# Altium project Ezlo_Voice_Assistant_Node.PrjPcb (part 2 of 2)

## Sheet ADC_Section.SchDoc
size A4; SheetNumber: 3; SheetTotal: 5
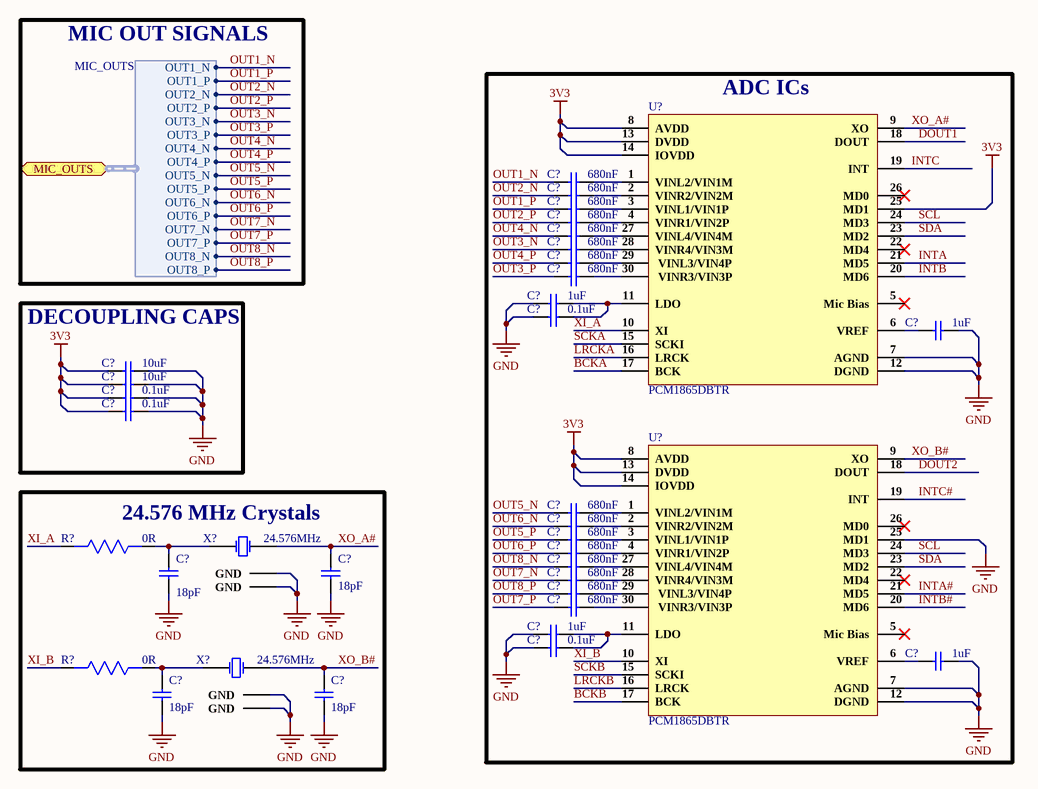
[diagram p2: ADC_Section.SchDoc]

### Parts
(Parts that share a designator on the sheet are numbered #1, #2 ... from top to bottom, then left to right.)
C?#17  680nF  [Cap 0603]
C?#18  680nF  [Cap 0603]
C?#19  680nF  [Cap 0603]
C?#20  680nF  [Cap 0603]
C?#21  680nF  [Cap 0603]
C?#22  680nF  [Cap 0603]
C?#23  680nF  [Cap 0603]
C?#24  680nF  [Cap 0603]
C?#25  1uF  [Cap 0603]
C?#26  0.1uF  [Cap 0603]
C?#27  1uF  [Cap 0603]
C?#28  10uF  [Cap 0603]
C?#29  10uF  [Cap 0603]
C?#30  0.1uF  [Cap 0603]
C?#31  0.1uF  [Cap 0603]
C?#32  680nF  [Cap 0603]
C?#33  680nF  [Cap 0603]
C?#34  680nF  [Cap 0603]
C?#35  680nF  [Cap 0603]
C?#36  680nF  [Cap 0603]
C?#37  680nF  [Cap 0603]
C?#38  18pF  [Cap 0603]
C?#39  18pF  [Cap 0603]
C?#40  680nF  [Cap 0603]
C?#41  680nF  [Cap 0603]
C?#42  1uF  [Cap 0603]
C?#43  0.1uF  [Cap 0603]
C?#44  1uF  [Cap 0603]
C?#45  18pF  [Cap0603]
C?#46  18pF  [Cap0603]
R?#8  0R  [Res0603]
R?#9  0R  [Res0603]
U?#7  PCM1865DBTR  [PCM1865DBTR]
U?#8  PCM1865DBTR  [PCM1865DBTR]
X?#2  24.576MHz  [S3224576121060]
X?#3  24.576MHz  [S3224576121060]

### Blocks framed on the sheet
ADC ICs: C?#17-C?#27 C?#32-C?#37 C?#40-C?#44 U?#7 U?#8
DECOUPLING CAPS: C?#28-C?#31
24.576 MHz Crystals: C?#38 C?#39 C?#45 C?#46 R?#8 R?#9 X?#2 X?#3

### Ports
MIC_OUTS (bidir, harness MIC_OUTS)

### Harnesses
MIC_OUTS: OUT1_N, OUT1_P, OUT2_N, OUT2_P, OUT3_N, OUT3_P, OUT4_N, OUT4_P, OUT5_N, OUT5_P, OUT6_N, OUT6_P, OUT7_N, OUT7_P, OUT8_N, OUT8_P

### Nets
3V3: C?#28.1 C?#29.1 C?#30.1 C?#31.1 U?#7.8(AVDD) U?#7.13(DVDD) U?#7.14(IOVDD) U?#7.25(MD1) U?#8.8(AVDD) U?#8.13(DVDD) U?#8.14(IOVDD)
GND: C?#25.1 C?#26.1 C?#27.2 C?#28.2 C?#29.2 C?#30.2 C?#31.2 C?#38.1 C?#39.1 C?#42.1 C?#43.1 C?#44.2 C?#45.1 C?#46.1 U?#7.7(AGND) U?#7.12(DGND) U?#8.7(AGND) U?#8.12(DGND) U?#8.25(MD1) X?#2.2(GND) X?#2.4(GND) X?#3.2(GND) X?#3.4(GND)
BCKA: U?#7.17(BCK)
BCKB: U?#8.17(BCK)
DOUT1: U?#7.18(DOUT)
DOUT2: U?#8.18(DOUT)
INTA: U?#7.21(MD5)
INTA#: U?#8.21(MD5)
INTB: U?#7.20(MD6)
INTB#: U?#8.20(MD6)
INTC: U?#7.19(INT)
INTC#: U?#8.19(INT)
LRCKA: U?#7.16(LRCK)
LRCKB: U?#8.16(LRCK)
OUT1_N: C?#17.1 ; port MIC_OUTS.OUT1_N
OUT1_P: C?#19.1 ; port MIC_OUTS.OUT1_P
OUT2_N: C?#18.1 ; port MIC_OUTS.OUT2_N
OUT2_P: C?#20.1 ; port MIC_OUTS.OUT2_P
OUT3_N: C?#22.1 ; port MIC_OUTS.OUT3_N
OUT3_P: C?#24.1 ; port MIC_OUTS.OUT3_P
OUT4_N: C?#21.1 ; port MIC_OUTS.OUT4_N
OUT4_P: C?#23.1 ; port MIC_OUTS.OUT4_P
OUT5_N: C?#32.1 ; port MIC_OUTS.OUT5_N
OUT5_P: C?#34.1 ; port MIC_OUTS.OUT5_P
OUT6_N: C?#33.1 ; port MIC_OUTS.OUT6_N
OUT6_P: C?#35.1 ; port MIC_OUTS.OUT6_P
OUT7_N: C?#37.1 ; port MIC_OUTS.OUT7_N
OUT7_P: C?#41.1 ; port MIC_OUTS.OUT7_P
OUT8_N: C?#36.1 ; port MIC_OUTS.OUT8_N
OUT8_P: C?#40.1 ; port MIC_OUTS.OUT8_P
SCKA: U?#7.15(SCKI)
SCKB: U?#8.15(SCKI)
SCL: U?#7.24(MD3) U?#8.24(MD3)
SDA: U?#7.23(MD2) U?#8.23(MD2)
XI_A: R?#8.2 U?#7.10(XI)
XI_B: R?#9.2 U?#8.10(XI)
XO_A#: C?#39.2 U?#7.9(XO) X?#2.3(OSC2)
XO_B#: C?#46.2 U?#8.9(XO) X?#3.3(OSC2)
NetC?#17_2: C?#17.2 U?#7.1(VINL2/VIN1M)
NetC?#18_2: C?#18.2 U?#7.2(VINR2/VIN2M)
NetC?#19_2: C?#19.2 U?#7.3(VINL1/VIN1P)
NetC?#20_2: C?#20.2 U?#7.4(VINR1/VIN2P)
NetC?#21_2: C?#21.2 U?#7.27(VINL4/VIN4M)
NetC?#22_2: C?#22.2 U?#7.28(VINR4/VIN3M)
NetC?#23_2: C?#23.2 U?#7.29(VINL3/VIN4P)
NetC?#24_2: C?#24.2 U?#7.30(VINR3/VIN3P)
NetC?#25_2: C?#25.2 C?#26.2 U?#7.11(LDO)
NetC?#27_1: C?#27.1 U?#7.6(VREF)
NetC?#32_2: C?#32.2 U?#8.1(VINL2/VIN1M)
NetC?#33_2: C?#33.2 U?#8.2(VINR2/VIN2M)
NetC?#34_2: C?#34.2 U?#8.3(VINL1/VIN1P)
NetC?#35_2: C?#35.2 U?#8.4(VINR1/VIN2P)
NetC?#36_2: C?#36.2 U?#8.27(VINL4/VIN4M)
NetC?#37_2: C?#37.2 U?#8.28(VINR4/VIN3M)
NetC?#38_2: C?#38.2 R?#8.1 X?#2.1(OSC1)
NetC?#40_2: C?#40.2 U?#8.29(VINL3/VIN4P)
NetC?#41_2: C?#41.2 U?#8.30(VINR3/VIN3P)
NetC?#42_2: C?#42.2 C?#43.2 U?#8.11(LDO)
NetC?#44_1: C?#44.1 U?#8.6(VREF)
NetC?#45_2: C?#45.2 R?#9.1 X?#3.1(OSC1)

Not connected (* = marked no-connect by the designer): U?#7 5(Mic_Bias)* 22(MD4)* 26(MD0)*; U?#8 5(Mic_Bias)* 22(MD4)* 26(MD0)*

### Notes on the sheet
- MIC OUT SIGNALS
- 1
- Huzaifa Ali

### Library data of the parts
C?#17-C?#24 C?#32-C?#37 C?#40 C?#41 = CC0603KRX7R8BB684: CAP CER 0.68uF 25V X7R 10% 0603 Paper T/R; Manufacturer: Yageo; Supplier 1: Arrow Electronics; Manufacturer Part Number: CC0603KRX7R8BB684; RoHS: Yes; Category: Ceramic Capacitors; Stock 1: 8000; Pricing 1: 4000=0.02130, 8000=0.01830 (USD); Supplier Part Number 1: CC0603KRX7R8BB684
C?#25 C?#27 C?#42 C?#44 = CC0603KRX5R8BB105: CAP CER 1UF 25V X5R 0603; Manufacturer: Yageo; Tolerance: 10%; Supplier 1: Digi-Key; Manufacturer Part Number: CC0603KRX5R8BB105; RoHS: Yes; Category: Ceramic Capacitors; Stock 1: 919939; Pricing 1: 1=0.12000, 10=0.08400, 50=0.04760, 100=0.03940, 500=0.02764, 1000=0.02288 (USD); Mount: Surface Mount; Case/Package: 0603; Number of Pins: 2; Case Code (Metric): 1608; Case Code (Imperial): 0603; Min Operating Temperature: -55°C; Max Operating Temperature: 85°C; Capacitance: 1uF; Dielectric: X5R; Package Quantity: 1; Voltage Rating: 25V; Packaging: Tape and Reel; Termination: SMD/SMT; Voltage Rating (DC): 25V; Series: CC; Construction: Flat; Length: 1.6mm; Width: 0.031inch; Height: 0.8mm; Thickness: 0.035inch; Depth: 0.8mm; Radiation Hardening: No; REACH SVHC: No SVHC; Lead Free: Lead Free; Halogen Free: Halogen Free; RoHS Compliant: Yes; ComponentLink1URL: https://datasheet.ciiva.com/176/mlccorderingcode-176785.pdf?src-supplier=Digi-Key; ComponentLink1Description: https://datasheet.ciiva.com/176/mlccorderingcode-176785.pdf?src-supplier=Digi-Key; ComponentLink2URL: https://datasheet.ciiva.com/176/mlccorderingcode-176786.pdf?src-supplier=Digi-Key; ComponentLink2Description: https://datasheet.ciiva.com/176/mlccorderingcode-176786.pdf?src-supplier=Digi-Key; ComponentLink3URL: https://datasheet.ciiva.com/176/mlccorderingcode-176787.pdf?src-supplier=Digi-Key; ComponentLink3Description: https://datasheet.ciiva.com/176/mlccorderingcode-176787.pdf?src-supplier=Digi-Key; ComponentLink4URL: https://datasheet.ciiva.com/17436/upy-gphc-x5r-4v-to-50v-12-17436952.pdf?src-supplier=Avnet+Europe; ComponentLink4Description: https://datasheet.ciiva.com/17436/upy-gphc-x5r-4v-to-50v-12-17436952.pdf?src-supplier=Avnet+Europe; ComponentLink5URL: https://datasheet.ciiva.com/7978/1525783-7978171.pdf?src-supplier=Element14; ComponentLink5Description: https://datasheet.ciiva.com/7978/1525783-7978171.pdf?src-supplier=Element14; ComponentLink6URL: https://datasheet.ciiva.com/11586/upy-gphc-x5r-4v-to-50v-12-11586318.pdf?src-supplier=Avnet; ComponentLink6Description: https://datasheet.ciiva.com/11586/upy-gphc-x5r-4v-to-50v-12-11586318.pdf?src-supplier=Avnet; Supplier Part Number 1: 311-1445-1-ND
C?#26 C?#30 C?#31 C?#43 = CC0603KRX7R0BB104: CAP CER 0.1UF 100V X7R 0603; Manufacturer: Yageo; Capacitance: 100nF; Tolerance: 10%; Supplier 1: Digi-Key; Manufacturer Part Number: CC0603KRX7R0BB104; RoHS: Yes; Category: Ceramic Capacitors; Stock 1: 60476; Pricing 1: 1=0.19000, 10=0.13500, 50=0.07680, 100=0.06370, 500=0.04466, 1000=0.03696 (USD); Mount: Surface Mount; Case/Package: 0603; Case Code (Metric): 1608; Case Code (Imperial): 0603; Weight: 7.1E-05oz; Min Operating Temperature: -55°C; Max Operating Temperature: 125°C; Package Quantity: 4000; Voltage Rating: 100V; Packaging: Tape and Reel; Dielectric: X7R; Termination: SMD/SMT; Resistor Type: Ceramic; Voltage Rating (DC): 100V; Series: CC; Length: 0.063inch; Width: 0.031inch; Thickness: 0.035inch; Depth: 0.8mm; Lead Free: Lead Free; RoHS Compliant: Yes; ComponentLink1URL: https://datasheet.ciiva.com/6277/mlccorderingcode-6277030.pdf?src-supplier=Digi-Key; ComponentLink1Description: https://datasheet.ciiva.com/6277/mlccorderingcode-6277030.pdf?src-supplier=Digi-Key; ComponentLink2URL: https://datasheet.ciiva.com/6277/mlccorderingcode-6277081.pdf?src-supplier=Digi-Key; ComponentLink2Description: https://datasheet.ciiva.com/6277/mlccorderingcode-6277081.pdf?src-supplier=Digi-Key; ComponentLink3URL: https://datasheet.ciiva.com/6277/mlccorderingcode-6277082.pdf?src-supplier=Digi-Key; ComponentLink3Description: https://datasheet.ciiva.com/6277/mlccorderingcode-6277082.pdf?src-supplier=Digi-Key; Supplier Part Number 1: 311-1523-1-ND
C?#28 C?#29 = CL10A106MA8NRNC: CAP CER 10UF 25V X5R 0603; Manufacturer: Samsung; Tolerance: 20%; Supplier 1: Avnet; Manufacturer Part Number: CL10A106MA8NRNC; RoHS: Yes; Category: Ceramic Capacitors; Pricing 1: 4000=0.03753, 8000=0.03700, 16000=0.03595, 24000=0.03515, 32000=0.03383, 40000=0.03304, 400000=0.03225 (USD); Mount: Surface Mount; Case/Package: 0603; Case Code (Metric): 1608; Case Code (Imperial): 0603; Contact Plating: Tin; Min Operating Temperature: -55°C; Max Operating Temperature: 85°C; Package Quantity: 1; Packaging: Tape and Reel; Capacitance: 10uF; Voltage Rating: 25V; Dielectric: X5R; Termination: Wraparound; Series: CL; Construction: Flat; Length: 0.063inch; Width: 0.031inch; Thickness: 0.035inch; Lead Free: Lead Free; RoHS Compliant: Yes; ComponentLink1URL: https://datasheet.ciiva.com/25766/cl10a106ma8nrnc-25766562.pdf?src-supplier=Digi-Key; ComponentLink1Description: https://datasheet.ciiva.com/25766/cl10a106ma8nrnc-25766562.pdf?src-supplier=Digi-Key; Supplier Part Number 1: CL10A106MA8NRNC
C?#38 C?#39 = CC0603JRNPO9BN180: CAP SMD 18pF ±5.0% 50V NPO 0603; Manufacturer: Yageo; Tolerance: 5%; Dielectric: C0G; Temperature Coefficient: 30ppm/°C; Insulation Resistance: 100GR; Supplier 1: Newark; Manufacturer Part Number: CC0603JRNPO9BN180; RoHS: Yes; Category: Ceramic Capacitors; Stock 1: 77880; Pricing 1: 1=0.09900, 25=0.08000, 50=0.06900, 100=0.04700, 250=0.03600, 500=0.02800, 1000=0.02300, 2500=0.01900 (USD); Mount: Surface Mount; Case/Package: 0603; Number of Pins: 2; Case Code (Metric): 1608; Case Code (Imperial): 0603; Min Operating Temperature: -55°C; Max Operating Temperature: 125°C; Capacitance: 18pF; Packaging: Tape and Reel; Voltage Rating: 50V; Voltage Rating (DC): 50V; Package Quantity: 1; Termination: SMD/SMT; Resistor Type: Ceramic; Series: CC; Length: 1.6mm; Width: 0.031inch; Height: 0.8mm; Thickness: 0.035inch; Depth: 0.8mm; Radiation Hardening: No; REACH SVHC: No SVHC; Lead Free: Lead Free; RoHS Compliant: Yes; ComponentLink1URL: https://datasheet.ciiva.com/144/mlccorderingcode-144638.pdf?src-supplier=Digi-Key; ComponentLink1Description: https://datasheet.ciiva.com/144/mlccorderingcode-144638.pdf?src-supplier=Digi-Key; ComponentLink2URL: https://datasheet.ciiva.com/144/mlccorderingcode-144637.pdf?src-supplier=Digi-Key; ComponentLink2Description: https://datasheet.ciiva.com/144/mlccorderingcode-144637.pdf?src-supplier=Digi-Key; ComponentLink3URL: https://datasheet.ciiva.com/144/mlccorderingcode-144639.pdf?src-supplier=Digi-Key; ComponentLink3Description: https://datasheet.ciiva.com/144/mlccorderingcode-144639.pdf?src-supplier=Digi-Key; ComponentLink4URL: https://datasheet.ciiva.com/28450/1443161-28450477.pdf?src-supplier=Element14; ComponentLink4Description: https://datasheet.ciiva.com/28450/1443161-28450477.pdf?src-supplier=Element14; ComponentLink5URL: https://datasheet.ciiva.com/46430/1835847-46430152.pdf?src-supplier=Element14; ComponentLink5Description: https://datasheet.ciiva.com/46430/1835847-46430152.pdf?src-supplier=Element14; ComponentLink6URL: https://datasheet.ciiva.com/5425/upy-gp-np0-16v-to-50v-8-5425439.pdf?src-supplier=Mouser; ComponentLink6Description: https://datasheet.ciiva.com/5425/upy-gp-np0-16v-to-50v-8-5425439.pdf?src-supplier=Mouser; ComponentLink7URL: https://datasheet.ciiva.com/8033/1734582-8033733.pdf?src-supplier=Element14; ComponentLink7Description: https://datasheet.ciiva.com/8033/1734582-8033733.pdf?src-supplier=Element14; ComponentLink8URL: https://datasheet.ciiva.com/11587/upy-gp-np0-16v-to-50v-8-11587323.pdf?src-supplier=Avnet; ComponentLink8Description: https://datasheet.ciiva.com/11587/upy-gp-np0-16v-to-50v-8-11587323.pdf?src-supplier=Avnet; Supplier Part Number 1: 68R4719
C?#45 C?#46 = CC0603JRNPO9BN180: CAP CER 18PF 50V C0G/NPO 0603; Manufacturer: Yageo; Tolerance: 5%; Dielectric: C0G; Temperature Coefficient: 30ppm/°C; Insulation Resistance: 100GR; Supplier 1: Digi-Key; Manufacturer Part Number: CC0603JRNPO9BN180; RoHS: Yes; Category: Ceramic Capacitors; Stock 1: 936645; Pricing 1: 1=0.10000, 10=0.04000, 50=0.02200, 100=0.01790, 500=0.01282, 1000=0.01007 (USD); Mount: Surface Mount; Case/Package: 0603; Number of Pins: 2; Case Code (Metric): 1608; Case Code (Imperial): 0603; Min Operating Temperature: -55°C; Max Operating Temperature: 125°C; Capacitance: 18pF; Packaging: Tape and Reel; Voltage Rating: 50V; Voltage Rating (DC): 50V; Package Quantity: 1; Termination: SMD/SMT; Resistor Type: Ceramic; Series: CC; Length: 1.6mm; Width: 0.031inch; Height: 0.8mm; Thickness: 0.035inch; Depth: 0.8mm; Radiation Hardening: No; REACH SVHC: No SVHC; Lead Free: Lead Free; RoHS Compliant: Yes; ComponentLink1URL: https://datasheet.ciiva.com/144/mlccorderingcode-144638.pdf?src-supplier=Digi-Key; ComponentLink1Description: https://datasheet.ciiva.com/144/mlccorderingcode-144638.pdf?src-supplier=Digi-Key; ComponentLink2URL: https://datasheet.ciiva.com/144/mlccorderingcode-144637.pdf?src-supplier=Digi-Key; ComponentLink2Description: https://datasheet.ciiva.com/144/mlccorderingcode-144637.pdf?src-supplier=Digi-Key; ComponentLink3URL: https://datasheet.ciiva.com/144/mlccorderingcode-144639.pdf?src-supplier=Digi-Key; ComponentLink3Description: https://datasheet.ciiva.com/144/mlccorderingcode-144639.pdf?src-supplier=Digi-Key; ComponentLink4URL: https://datasheet.ciiva.com/28450/1443161-28450477.pdf?src-supplier=Element14; ComponentLink4Description: https://datasheet.ciiva.com/28450/1443161-28450477.pdf?src-supplier=Element14; ComponentLink5URL: https://datasheet.ciiva.com/46430/1835847-46430152.pdf?src-supplier=Element14; ComponentLink5Description: https://datasheet.ciiva.com/46430/1835847-46430152.pdf?src-supplier=Element14; ComponentLink6URL: https://datasheet.ciiva.com/5425/upy-gp-np0-16v-to-50v-8-5425439.pdf?src-supplier=Mouser; ComponentLink6Description: https://datasheet.ciiva.com/5425/upy-gp-np0-16v-to-50v-8-5425439.pdf?src-supplier=Mouser; ComponentLink7URL: https://datasheet.ciiva.com/8033/1734582-8033733.pdf?src-supplier=Element14; ComponentLink7Description: https://datasheet.ciiva.com/8033/1734582-8033733.pdf?src-supplier=Element14; ComponentLink8URL: https://datasheet.ciiva.com/11587/upy-gp-np0-16v-to-50v-8-11587323.pdf?src-supplier=Avnet; ComponentLink8Description: https://datasheet.ciiva.com/11587/upy-gp-np0-16v-to-50v-8-11587323.pdf?src-supplier=Avnet; Supplier Part Number 1: 311-1061-6-ND
R?#8 R?#9 = RC0603FR-070RL: RES SMD 0R, 1%, 0.1W, 0603; Manufacturer: Yageo; Resistance: 0mR; Power Rating: 100mW; Voltage Rating (DC): 50V; Temperature Coefficient: 200ppm/°C; Current Rating: 1A; Working Voltage: 75V; Supplier 1: Arrow Electronics; Manufacturer Part Number: RC0603FR-070RL; RoHS: Yes; Category: Chip SMD Resistors; Stock 1: 1270000; Pricing 1: 5000=0.00320, 5000=0.00490, 50000=0.00450, 500000=0.00250, 2500000=0.00150 (USD); Case/Package: 0603; Number of Pins: 2; Contact Plating: Tin,Matte; Case Code (Metric): 1608; Case Code (Imperial): 0603; Min Operating Temperature: -55°C; Max Operating Temperature: 155°C; Resistor Type: Thick Film; Packaging: Tape and Reel; Tolerance: 1%; Package Quantity: 5000; Voltage Rating: 50V; Number of Terminations: 2; Termination: SMD/SMT; Max Power Dissipation: 100mW; Features: Moisture Resistant; Length: 1.6mm; Width: 0.031inch; Height: 0.45mm; Depth: 0.8mm; Radiation Hardening: No; REACH SVHC: No SVHC; Lead Free: Lead Free; Military Standard: Not; ComponentLink1URL: https://datasheet.ciiva.com/11808/0900766b80f96399-11808172.pdf?src-supplier=RSComponents; ComponentLink1Description: https://datasheet.ciiva.com/11808/0900766b80f96399-11808172.pdf?src-supplier=RSComponents; ComponentLink2URL: https://datasheet.ciiva.com/5558/rc0603-272842-5558341.pdf?src-supplier=Mouser; ComponentLink2Description: https://datasheet.ciiva.com/5558/rc0603-272842-5558341.pdf?src-supplier=Mouser; ComponentLink3URL: https://datasheet.ciiva.com/46382/443971-46382072.pdf?src-supplier=Element14; ComponentLink3Description: https://datasheet.ciiva.com/46382/443971-46382072.pdf?src-supplier=Element14; ComponentLink4URL: https://datasheet.ciiva.com/29721/pyu-r-int-thick-7-29721178.pdf?src-supplier=Digi-Key; ComponentLink4Description: https://datasheet.ciiva.com/29721/pyu-r-int-thick-7-29721178.pdf?src-supplier=Digi-Key; ComponentLink5URL: https://datasheet.ciiva.com/5684/443971-5684699.pdf?src-supplier=Farnell; ComponentLink5Description: https://datasheet.ciiva.com/5684/443971-5684699.pdf?src-supplier=Farnell; ComponentLink6URL: https://datasheet.ciiva.com/7983/443971-7983627.pdf?src-supplier=Element14; ComponentLink6Description: https://datasheet.ciiva.com/7983/443971-7983627.pdf?src-supplier=Element14; ComponentLink7URL: https://datasheet.ciiva.com/29721/pyu-rc0603-51-rohs-l-4-29721179.pdf?src-supplier=Digi-Key; ComponentLink7Description: https://datasheet.ciiva.com/29721/pyu-rc0603-51-rohs-l-4-29721179.pdf?src-supplier=Digi-Key; ComponentLink8URL: https://datasheet.ciiva.com/22643/1868787-22643388.pdf?src-supplier=Element14; ComponentLink8Description: https://datasheet.ciiva.com/22643/1868787-22643388.pdf?src-supplier=Element14; Supplier Part Number 1: RC0603FR-070RL
U?#7 U?#8 = PCM1865DBTR: IC ADC/AUDIO 24BIT 192K 30TSSOP; Manufacturer: Texas Instruments; Interface: I2C,SPI,Serial; Operating Supply Voltage: 3.3V; Sampling Rate: 192KS/s; Resolution: 24b; Operating Supply Current: 31mA; Supply Type: Single; Number of A/D Converters: 4; Power Consumption: 145mW; Max Supply Voltage: 3.6V; Min Supply Voltage: 3V; Number of Analog Inputs: 8; Number of DAC Channels: 0; Supplier 1: Mouser; Manufacturer Part Number: PCM1865DBTR; RoHS: Yes; Category: Amplifiers - Audio; Pricing 1: 1=10.72000, 10=9.69000, 25=9.23000, 50=9.23000, 100=8.02000, 250=7.66000, 500=6.98000, 1000=6.54000, 10000=6.54000 (USD); Mount: Surface Mount; Case/Package: TSSOP; Number of Pins: 30; Weight: 0.003439oz; Contact Plating: Gold; Min Operating Temperature: -40°C; Max Operating Temperature: 125°C; Package Quantity: 2000; Packaging: Tape and Reel; Number of ADC Channels: 4; Lead Free: Lead Free; RoHS Compliant: Yes; ComponentLink1URL: https://datasheet.ciiva.com/48474/pcm1861-48474798.pdf?src-supplier=Avnet; ComponentLink1Description: https://datasheet.ciiva.com/48474/pcm1861-48474798.pdf?src-supplier=Avnet; ComponentLink2URL: https://datasheet.ciiva.com/29699/pcm1861-29699238.pdf?src-supplier=Digi-Key; ComponentLink2Description: https://datasheet.ciiva.com/29699/pcm1861-29699238.pdf?src-supplier=Digi-Key; Supplier Part Number 1: 595-PCM1865DBTR
X?#2 X?#3 = S3224576121060: 24.576MHz SMD Crystal Resonator 12pF 60Ω ±10ppm -40℃~+85℃ SMD3225-4P Crystals ROHS; Manufacturer: JGHC; Manufacturer Part Number: S3224576121060; Footprint: Custom; ComponentLink1Description: LCSC; ComponentLink1URL: https://lcsc.com/product-detail/Crystals_JGHC-S3224576121060_C390772.html; Value: 24.576MHz

## Sheet Memory_Section.SchDoc
size A; SheetNumber: 4; SheetTotal: 5
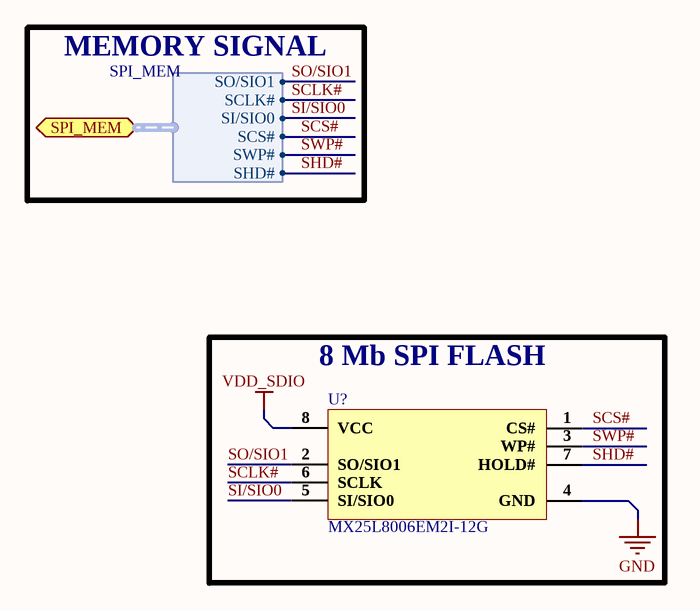
[diagram p3: Memory_Section.SchDoc]

### Parts
(Parts that share a designator on the sheet are numbered #1, #2 ... from top to bottom, then left to right.)
U?#9  MX25L8006EM2I-12G  [SOP- 8]

### Blocks framed on the sheet
8 Mb SPI FLASH: U?#9

### Ports
SPI_MEM (bidir, harness SPI_MEM)

### Harnesses
SPI_MEM: SO/SIO1, SCLK#, SI/SIO0, SCS#, SWP#, SHD#

### Nets
GND: U?#9.4(GND)
VDD_SDIO: U?#9.8(VCC)
SCLK#: U?#9.6(SCLK) ; port SPI_MEM.SCLK#
SCS#: U?#9.1(CS#) ; port SPI_MEM.SCS#
SHD#: U?#9.7(HOLD#) ; port SPI_MEM.SHD#
SI/SIO0: U?#9.5(SI/SIO0) ; port SPI_MEM.SI/SIO0
SO/SIO1: U?#9.2(SO/SIO1) ; port SPI_MEM.SO/SIO1
SWP#: U?#9.3(WP#) ; port SPI_MEM.SWP#

### Notes on the sheet
- MEMORY SIGNAL

### Library data of the parts
U?#9 = MX25L8006EM2I-12G: IC FLASH 8MBIT SPI 86MHZ 8SOP; Manufacturer: Macronix; Operating Supply Voltage: 3.6V; Density: 8Mb; Interface: SPI,Serial; Memory Type: Non-Volatile,FLASH; Supplier 1: Future Electronics; Manufacturer Part Number: MX25L8006EM2I-12G; RoHS: Yes; Category: Flash; Stock 1: 5568; Pricing 1: 1=0.54000, 75=0.47500, 250=0.46000, 750=0.44500, 2500=0.43000 (USD); Mount: Surface Mount; Case/Package: SOIC; Min Operating Temperature: -40°C; Max Operating Temperature: 85°C; Max Frequency: 86MHz; Packaging: Rail/Tube; Package Quantity: 98; Frequency: 86MHz; Memory Size: 8Mb; Series: MX25xxx05/06; Supply Voltage-Nom: 3.6V; Lead Free: Lead Free; Temperature Grade: INDUSTRIAL; RoHS Compliant: Yes; ComponentLink1URL: http://ckassoc.com/oldsite/pdf/Macronix_Product_Line_Card_July_2017_General%20_070617.pdf?src-supplier=Digi-Key; ComponentLink1Description: http://ckassoc.com/oldsite/pdf/Macronix_Product_Line_Card_July_2017_General%20_070617.pdf?src-supplier=Digi-Key; ComponentLink2URL: http://www.macronix.com/Lists/DataSheet/Attachments/1610/MX25L8006E,%203V,%208Mb,%20v1.4.pdf?src-supplier=Future+Electronics; ComponentLink2Description: http://www.macronix.com/Lists/DataSheet/Attachments/1610/MX25L8006E,%203V,%208Mb,%20v1.4.pdf?src-supplier=Future+Electronics; Supplier Part Number 1: 1123114

## Sheet Mic_Section.SchDoc
size A4; SheetNumber: 5; SheetTotal: 5
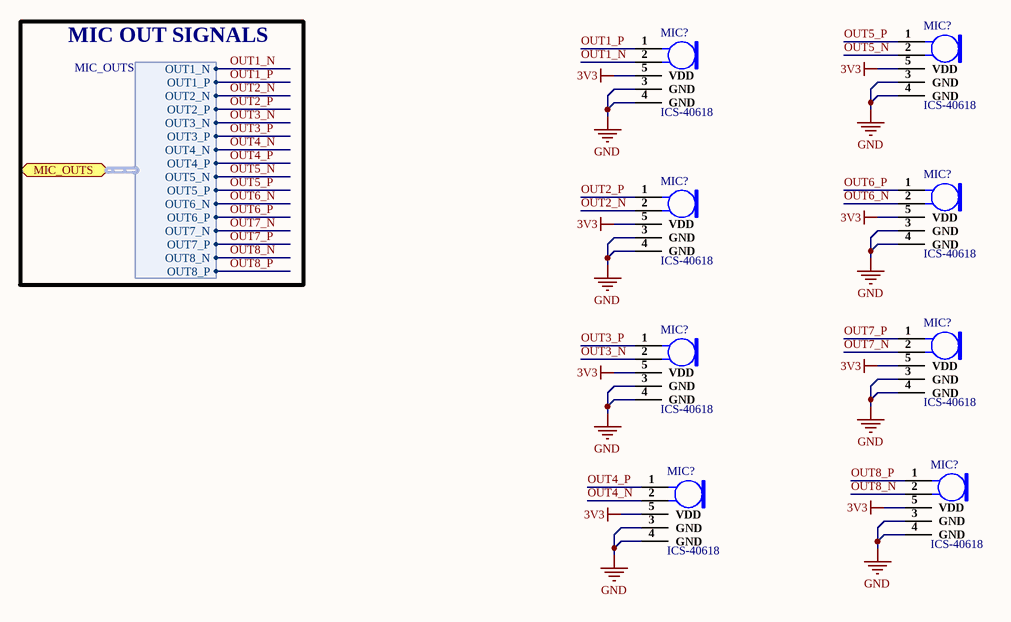
[diagram p4: Mic_Section.SchDoc]

### Parts
(Parts that share a designator on the sheet are numbered #1, #2 ... from top to bottom, then left to right.)
MIC?#1  ICS-40618  [ICS-40618]
MIC?#2  ICS-40618  [ICS-40618]
MIC?#3  ICS-40618  [ICS-40618]
MIC?#4  ICS-40618  [ICS-40618]
MIC?#5  ICS-40618  [ICS-40618]
MIC?#6  ICS-40618  [ICS-40618]
MIC?#7  ICS-40618  [ICS-40618]
MIC?#8  ICS-40618  [ICS-40618]

### Ports
MIC_OUTS (bidir, harness MIC_OUTS)

### Harnesses
MIC_OUTS: OUT1_N, OUT1_P, OUT2_N, OUT2_P, OUT3_N, OUT3_P, OUT4_N, OUT4_P, OUT5_N, OUT5_P, OUT6_N, OUT6_P, OUT7_N, OUT7_P, OUT8_N, OUT8_P

### Nets
3V3: MIC?#1.5(VDD) MIC?#2.5(VDD) MIC?#3.5(VDD) MIC?#4.5(VDD) MIC?#5.5(VDD) MIC?#6.5(VDD) MIC?#7.5(VDD) MIC?#8.5(VDD)
GND: MIC?#1.3(GND) MIC?#1.4(GND) MIC?#2.3(GND) MIC?#2.4(GND) MIC?#3.3(GND) MIC?#3.4(GND) MIC?#4.3(GND) MIC?#4.4(GND) MIC?#5.3(GND) MIC?#5.4(GND) MIC?#6.3(GND) MIC?#6.4(GND) MIC?#7.3(GND) MIC?#7.4(GND) MIC?#8.3(GND) MIC?#8.4(GND)
OUT1_N: MIC?#2.2(OUTPUT-) ; port MIC_OUTS.OUT1_N
OUT1_P: MIC?#2.1(OUTPUT+) ; port MIC_OUTS.OUT1_P
OUT2_N: MIC?#4.2(OUTPUT-) ; port MIC_OUTS.OUT2_N
OUT2_P: MIC?#4.1(OUTPUT+) ; port MIC_OUTS.OUT2_P
OUT3_N: MIC?#6.2(OUTPUT-) ; port MIC_OUTS.OUT3_N
OUT3_P: MIC?#6.1(OUTPUT+) ; port MIC_OUTS.OUT3_P
OUT4_N: MIC?#8.2(OUTPUT-) ; port MIC_OUTS.OUT4_N
OUT4_P: MIC?#8.1(OUTPUT+) ; port MIC_OUTS.OUT4_P
OUT5_N: MIC?#1.2(OUTPUT-) ; port MIC_OUTS.OUT5_N
OUT5_P: MIC?#1.1(OUTPUT+) ; port MIC_OUTS.OUT5_P
OUT6_N: MIC?#3.2(OUTPUT-) ; port MIC_OUTS.OUT6_N
OUT6_P: MIC?#3.1(OUTPUT+) ; port MIC_OUTS.OUT6_P
OUT7_N: MIC?#5.2(OUTPUT-) ; port MIC_OUTS.OUT7_N
OUT7_P: MIC?#5.1(OUTPUT+) ; port MIC_OUTS.OUT7_P
OUT8_N: MIC?#7.2(OUTPUT-) ; port MIC_OUTS.OUT8_N
OUT8_P: MIC?#7.1(OUTPUT+) ; port MIC_OUTS.OUT8_P

### Notes on the sheet
- MIC OUT SIGNALS
- 1
- Huzaifa Ali

### Library data of the parts
MIC?#1-MIC?#8 = ICS-40618: ICS-40618 High SNR Microphone with Differential Output and Low-Power Mode; Manufacturer: TDK InvenSense; Shape: Rectangular; Direction: Omnidirectional; Operating Supply Current: 190uA; Output Type: Analog; Supplier 1: RSComponents; Manufacturer Part Number: ICS-40618; RoHS: No; Category: Microphones; Stock 1: 500; Pricing 1: 200=1.80400, 1000=1.75400, 2500=1.71200, 5000=1.66700 (GBP); Packaging: Tape and Reel; Termination: Solder; RoHS Compliant: No; ComponentLink1URL: https://www.mouser.com/ds/2/400/DS-000044-ICS-40618-v1.0-1115536.pdf?src-supplier=Mouser; ComponentLink1Description: https://www.mouser.com/ds/2/400/DS-000044-ICS-40618-v1.0-1115536.pdf?src-supplier=Mouser; ComponentLink2URL: https://www.invensense.com/wp-content/uploads/2016/02/DS-000044-ICS-40618-v1.0.pdf?src-supplier=Digi-Key; ComponentLink2Description: https://www.invensense.com/wp-content/uploads/2016/02/DS-000044-ICS-40618-v1.0.pdf?src-supplier=Digi-Key; Supplier Part Number 1: 2182224P

## Sheet DAC_Section.SchDoc
size A4; SheetNumber: 7; SheetTotal: 7
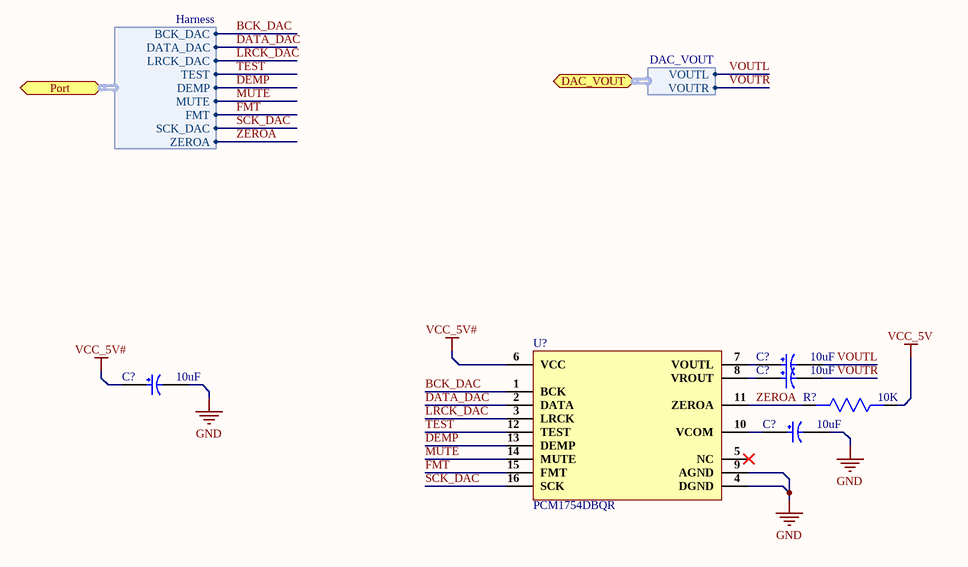
[diagram p5: DAC_Section.SchDoc]

### Parts
(Parts that share a designator on the sheet are numbered #1, #2 ... from top to bottom, then left to right.)
C?#47  10uF  [RVT1E100M0405.]
C?#48  10uF  [RVT1E100M0405.]
C?#49  10uF  [RVT1E100M0405.]
C?#50  10uF  [RVT1E100M0405.]
R?#10  10K  [Res0603]
U?#10  PCM1754DBQR  [16-SSOP]

### Ports
DAC_VOUT (bidir, harness DAC_VOUT), Port (bidir, harness Harness)

### Harnesses
Harness: BCK_DAC, DATA_DAC, LRCK_DAC, TEST, DEMP, MUTE, FMT, SCK_DAC, ZEROA
DAC_VOUT: VOUTL, VOUTR

### Nets
GND: C?#49.2 C?#50.2 U?#10.4(DGND) U?#10.9(AGND)
VCC_5V: R?#10.1
VCC_5V#: C?#49.1 U?#10.6(VCC)
BCK_DAC: U?#10.1(BCK) ; port Port.BCK_DAC
DATA_DAC: U?#10.2(DATA) ; port Port.DATA_DAC
DEMP: U?#10.13(DEMP) ; port Port.DEMP
FMT: U?#10.15(FMT) ; port Port.FMT
LRCK_DAC: U?#10.3(LRCK) ; port Port.LRCK_DAC
MUTE: U?#10.14(MUTE) ; port Port.MUTE
SCK_DAC: U?#10.16(SCK) ; port Port.SCK_DAC
TEST: U?#10.12(TEST) ; port Port.TEST
VOUTL: C?#47.2 ; port DAC_VOUT.VOUTL
VOUTR: C?#48.2 ; port DAC_VOUT.VOUTR
ZEROA: R?#10.2 U?#10.11(ZEROA) ; port Port.ZEROA
NetC?#47_1: C?#47.1 U?#10.7(VOUTL)
NetC?#48_1: C?#48.1 U?#10.8(VROUT)
NetC?#50_1: C?#50.1 U?#10.10(VCOM)

Not connected (* = marked no-connect by the designer): U?#10 5(NC)*

### Notes on the sheet
- 1
- Huzaifa Ali

### Library data of the parts
C?#47-C?#50 = RVT1E100M0405: CAP ALUM 10uF 25V SMD; Manufacturer: ROQANG; φD: 4mm; L: 5.4mm; Tolerance: ±20%; Operating Temperature: -45℃~+105℃; Rated Voltage: 25V; Capacitance: 10uF
R?#10 = AC0603JR-0710KL: RES SMD 10K OHM 5% 1/10W 0603; Manufacturer: Yageo; Voltage Rating: 50V; Resistance: 10kR; Power Rating: 100mW; Temperature Coefficient: 100ppm/°C; Supplier 1: Future Electronics; Manufacturer Part Number: AC0603JR-0710KL; RoHS: Yes; Category: Chip SMD Resistors; Stock 1: 1533000; Pricing 1: 5000=0.00540 (USD); Case/Package: 0603; Case Code (Imperial): 0603; Case Code (Metric): 1608; Size Code: 0603; Min Operating Temperature: -55°C; Max Operating Temperature: 155°C; Packaging: Tape and Reel; Tolerance: 5%; Package Quantity: 1; Resistor Type: Thick Film; Termination: SMD/SMT; Number of Terminations: 2; Max Power Dissipation: 100mW; Features: Moisture Resistant,Automotive AEC-Q200,Anti-Sulfur; Series: AC; Construction: Rectangular; Length: 0.063inch; Width: 0.031inch; Height: 0.022inch; Depth: 0.8mm; Military Standard: Not; Lead Free: Lead Free; RoHS Compliant: Yes; ComponentLink1URL: https://datasheet.ciiva.com/5562/pyu-ac-51-rohs-l-2-5562553.pdf?src-supplier=Mouser; ComponentLink1Description: https://datasheet.ciiva.com/5562/pyu-ac-51-rohs-l-2-5562553.pdf?src-supplier=Mouser; Supplier Part Number 1: 1029044
U?#10 = PCM1754DBQR: IC DAC/AUDIO 24BIT 200K 16SSOP; Manufacturer: Texas Instruments; Number of DAC Channels: 2; Operating Supply Voltage: 5V; Max Power Dissipation: 105mW; Interface: Serial,3-WIRE; Number of Bits: 24; Sampling Rate: 192000S/s; Resolution: 24b; Signal to Noise Ratio (SNR): 106dB; Supply Type: Single; Conversion Rate: 192KS/s; Nominal Supply Current: 30mA; Power Consumption: 80mW; Number of Analog Inputs: 0; Output Type: Voltage; Min Supply Voltage: 4.5V; Max Supply Voltage: 5.5V; Integral Nonlinearity (INL): 0.5LSB; Polarity: Bipolar; Supplier 1: Mouser; Manufacturer Part Number: PCM1754DBQR; RoHS: Yes; Category: Amplifiers - Audio; Stock 1: 908; Pricing 1: 1=2.14000, 10=1.93000, 25=1.82000, 50=1.82000, 100=1.55000, 250=1.46000, 500=1.28000, 1000=1.06000, 10000=1.06000 (USD); Mount: Surface Mount; Case/Package: SSOP; Number of Pins: 16; Weight: 0.002603oz; Contact Plating: Gold; Min Operating Temperature: -40°C; Max Operating Temperature: 85°C; Packaging: Tape and Reel; Number of Channels: 2; Package Quantity: 2000; Number of Converters: 2; Number of Analog Outputs: 2; Series: PCM1754; Output Polarity: Bipolar; Length: 5mm; Width: 4mm; Height: 1.5mm; Radiation Hardening: No; Lead Free: Lead Free; RoHS Compliant: Yes; ComponentLink1URL: https://datasheet.ciiva.com/41460/001186173-da-01-en-ic-dac-24bit-mon-pcm1754dbqr-ssop-16-tid-41460109.pdf?src-supplier=Conrad; ComponentLink1Description: https://datasheet.ciiva.com/41460/001186173-da-01-en-ic-dac-24bit-mon-pcm1754dbqr-ssop-16-tid-41460109.pdf?src-supplier=Conrad; ComponentLink2URL: https://datasheet.ciiva.com/1388/pcm1753-1388404.pdf?src-supplier=Digi-Key; ComponentLink2Description: https://datasheet.ciiva.com/1388/pcm1753-1388404.pdf?src-supplier=Digi-Key; ComponentLink3URL: https://datasheet.ciiva.com/1388/pcm1753-1388403.pdf?src-supplier=Digi-Key; ComponentLink3Description: https://datasheet.ciiva.com/1388/pcm1753-1388403.pdf?src-supplier=Digi-Key; ComponentLink4URL: https://datasheet.ciiva.com/1388/pcm1753-1388405.pdf?src-supplier=Digi-Key; ComponentLink4Description: https://datasheet.ciiva.com/1388/pcm1753-1388405.pdf?src-supplier=Digi-Key; ComponentLink5URL: https://datasheet.ciiva.com/15146/getdatasheetpartid-213919-15146955.pdf?src-supplier=Verical; ComponentLink5Description: https://datasheet.ciiva.com/15146/getdatasheetpartid-213919-15146955.pdf?src-supplier=Verical; Supplier Part Number 1: 595-PCM1754DBQR

## Sheet Amplifier_Section.SchDoc
size A4; SheetNumber: 8; SheetTotal: 9
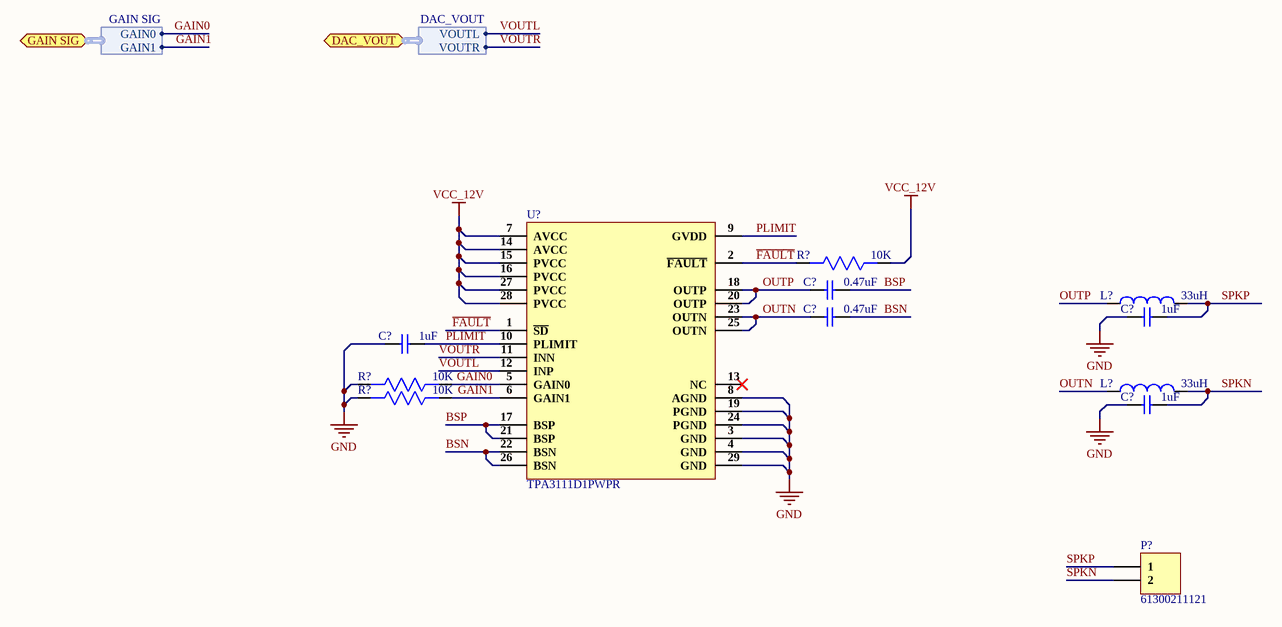
[diagram p6: Amplifier_Section.SchDoc]

### Parts
(Parts that share a designator on the sheet are numbered #1, #2 ... from top to bottom, then left to right.)
C?#51  0.47uF  [Cap0603]
C?#52  0.47uF  [Cap0603]
C?#53  1uF  [Cap0603]
C?#54  1uF  [Cap0603]
C?#55  1uF  [Cap0603]
L?#3  33uH  [SWPA5040S330MT]
L?#4  33uH  [SWPA5040S330MT]
P?  61300211121  [HDR1X2]
R?#11  10K  [Res0603]
R?#12  10K  [Res0603]
R?#13  10K  [Res0603]
U?#11  TPA3111D1PWPR  [28-HTSSOP]

### Ports
DAC_VOUT (bidir, harness DAC_VOUT), GAIN SIG (bidir, harness GAIN SIG)

### Harnesses
DAC_VOUT: VOUTL, VOUTR
GAIN SIG: GAIN0, GAIN1

### Nets
GND: C?#53.1 C?#54.1 C?#55.1 R?#12.2 R?#13.2 U?#11.3(GND) U?#11.4(GND) U?#11.8(AGND) U?#11.19(PGND) U?#11.24(PGND) U?#11.29(GND)
VCC_12V: R?#11.1 U?#11.7(AVCC) U?#11.14(AVCC) U?#11.15(PVCC) U?#11.16(PVCC) U?#11.27(PVCC) U?#11.28(PVCC)
~{FAULT}: R?#11.2 U?#11.1(~{SD}) U?#11.2(~{FAULT})
BSN: C?#52.2 U?#11.22(BSN) U?#11.26(BSN)
BSP: C?#51.2 U?#11.17(BSP) U?#11.21(BSP)
GAIN0: R?#12.1 U?#11.5(GAIN0) ; port GAIN SIG.GAIN0
GAIN1: R?#13.1 U?#11.6(GAIN1) ; port GAIN SIG.GAIN1
OUTN: C?#52.1 L?#4.1 U?#11.23(OUTN) U?#11.25(OUTN)
OUTP: C?#51.1 L?#3.1 U?#11.18(OUTP) U?#11.20(OUTP)
PLIMIT: C?#54.2 U?#11.9(GVDD) U?#11.10(PLIMIT)
SPKN: C?#55.2 L?#4.2 P?.2
SPKP: C?#53.2 L?#3.2 P?.1
VOUTL: U?#11.12(INP) ; port DAC_VOUT.VOUTL
VOUTR: U?#11.11(INN) ; port DAC_VOUT.VOUTR

Not connected (* = marked no-connect by the designer): U?#11 13(NC)*

### Notes on the sheet
- 1
- Huzaifa Ali

### Library data of the parts
C?#51 C?#52 = CL10A474KB8NNNC: CAP CER 0.47UF 50V X5R 0603; Manufacturer: Samsung; Tolerance: 10%; Capacitance: 470nF; Supplier 1: Arrow Electronics; Manufacturer Part Number: CL10A474KB8NNNC; RoHS: Yes; Category: Ceramic Capacitors; Stock 1: 196000; Pricing 1: 200000=0.04290, 300000=0.04250, 400000=0.04210, 500000=0.04170, 1000000=0.04120, 2000000=0.04080 (USD); Mount: Surface Mount; Case/Package: 0603; Case Code (Metric): 1608; Case Code (Imperial): 0603; Min Operating Temperature: -55°C; Max Operating Temperature: 85°C; Packaging: Tape and Reel; Package Quantity: 1; Voltage Rating: 50V; Dielectric: X5R; Series: CL; Construction: Flat; Voltage Rating (DC): 50V; Length: 1.6mm; Width: 0.031inch; Height: 0.8mm; Thickness: 0.035inch; Depth: 0.8mm; Radiation Hardening: No; RoHS Compliant: Yes; Lead Free: Lead Free; ComponentLink1URL: https://datasheet.ciiva.com/25798/cl10a474kb8nnnc-25798516.pdf?src-supplier=Digi-Key; ComponentLink1Description: https://datasheet.ciiva.com/25798/cl10a474kb8nnnc-25798516.pdf?src-supplier=Digi-Key; ComponentLink2URL: https://datasheet.ciiva.com/15195/getdatasheetpartid-353290-15195713.pdf?src-supplier=Verical; ComponentLink2Description: https://datasheet.ciiva.com/15195/getdatasheetpartid-353290-15195713.pdf?src-supplier=Verical; Supplier Part Number 1: CL10A474KB8NNNC
C?#53 C?#55 = UMK107AB7105KA-T: CAP CER 1UF 50V X7R 0603; Manufacturer: Taiyo Yuden; Tolerance: 10%; ComponentLink1URL: http://www.farnell.com/datasheets/2048165.pdf?src-supplier=Element14; ComponentLink1Description: http://www.farnell.com/datasheets/2048165.pdf?src-supplier=Element14; ComponentLink2URL: https://www.murata.com/~/media/webrenewal/support/library/catalog/products/capacitor/mlcc/c02e.ashx?la=en-us&src-supplier=Digi-Key; ComponentLink2Description: https://www.murata.com/~/media/webrenewal/support/library/catalog/products/capacitor/mlcc/c02e.ashx?la=en-us&src-supplier=Digi-Key; Supplier 1: Digi-Key; Manufacturer Part Number: UMK107AB7105KA-T; Stock 1: 453098; Pricing 1: 1=0.28, 10=0.19, 100=0.1079, 500=0.0762, 1000=0.0667 (USD); Mount: Surface Mount; Case/Package: 0603; Case Code (Metric): 1608; Case Code (Imperial): 0603; Min Operating Temperature: -55°C; Max Operating Temperature: 125°C; Packaging: Tape and Reel; Package Quantity: 1; Capacitance: 1uF; Voltage Rating: 50V; Voltage Rating (DC): 50V; Dielectric: X7R; Termination: SMD/SMT; Length: 1.6mm; Height: 0.8mm; Width: 0.031inch; Thickness: 0.037inch; Depth: 0.8mm; Radiation Hardening: No; Halogen Free: Halogen Free; ComponentLink3URL: https://www.yuden.co.jp/productdata/catalog/mlcc_all_e.pdf?src-supplier=Digi-Key; ComponentLink3Description: https://www.yuden.co.jp/productdata/catalog/mlcc_all_e.pdf?src-supplier=Digi-Key; ComponentLink4URL: https://www.yuden.co.jp/productdata/catalog/mlcc_all_e.pdf?src-supplier=Onlinecomponents.com; ComponentLink4Description: https://www.yuden.co.jp/productdata/catalog/mlcc_all_e.pdf?src-supplier=Onlinecomponents.com; Supplier Part Number 1: 587-3247-1-ND
C?#54 = CL10A105KA8NNNC: CAP CER 1UF 25V X5R 0603; Manufacturer: Sams; Tolerance: 10%; Supplier 1: Digi-Key; Manufacturer Part Number: CL10A105KA8NNNC; Stock 1: 2768758; Pricing 1: 1=0.1, 10=0.036, 50=0.0198, 100=0.0161, 500=0.01152, 1000=0.00904 (USD); Mount: Surface Mount; Case/Package: 0603; Min Operating Temperature: -55°C; Max Operating Temperature: 85°C; Capacitance: 1uF; Dielectric: X5R; Voltage Rating (DC): 25V; Voltage: 25V; Length: 1.6mm; Height: 0.8mm; Depth: 0.8mm; Lead Free: Lead Free; Supplier Part Number 1: 1276-1102-1-ND
L?#3 L?#4 = SWPA5040S330MT: Fixed Ind 3320%UH 0.188 Ohm 1450M; Manufacturer: Sunlord; Supplier 1: Digi-Key; Manufacturer Part Number: SWPA5040S330MT; RoHS: Yes; Category: Fixed Inductors; Pricing 1: 1500=0.24990 (USD); RoHS Compliant: Yes; Supplier Part Number 1: 3442-SWPA5040S330MTTR-ND
P? = 61300211121: CONN HEADER VERT 2POS 2.54MM; Manufacturer: Wurth Electronics; Current Rating: 3A; Voltage Rating: 250V; Number of Positions: 2; Gender: Male; Connector Type: Male Pin; Pitch: 0.1inch; Supplier 1: Digi-Key; Manufacturer Part Number: 61300211121; Stock 1: 219205; Pricing 1: 1=0.13, 10=0.106, 25=0.088, 50=0.074, 100=0.067, 1000=0.061 (USD); Mount: Through Hole; Contact Plating: Gold; Housing Material: PBT; Contact Material: Copper Alloy,Copper; Color: Black; Min Operating Temperature: -40°C; Max Operating Temperature: 125°C; Number of Rows: 1; Contact Gender: Male; Packaging: Bulk; Termination: Through Hole; Number of Contacts: 2; Contact Mating Length: 0.236inch; REACH SVHC: Unknown; Lead Free: Lead Free; ComponentLink1URL: http://www.mouser.com/ds/2/445/6130xx11121-538006.pdf?src-supplier=Mouser; ComponentLink1Description: http://www.mouser.com/ds/2/445/6130xx11121-538006.pdf?src-supplier=Mouser; Supplier Part Number 1: 732-5315-ND
R?#11-R?#13 = AC0603JR-0710KL: as R?#10 on sheet DAC_Section; Supplier 1: Future Electronics; Manufacturer Part Number: AC0603JR-0710KL; RoHS: Yes; Category: Chip SMD Resistors; Stock 1: 1533000; Pricing 1: 5000=0.00540 (USD); Case/Package: 0603; Case Code (Imperial): 0603; Case Code (Metric): 1608; Size Code: 0603; Min Operating Temperature: -55°C; Max Operating Temperature: 155°C; Packaging: Tape and Reel; Tolerance: 5%; Package Quantity: 1; Resistor Type: Thick Film; Termination: SMD/SMT; Number of Terminations: 2; Max Power Dissipation: 100mW; Features: Moisture Resistant,Automotive AEC-Q200,Anti-Sulfur; Series: AC; Construction: Rectangular; Length: 0.063inch; Width: 0.031inch; Height: 0.022inch; Depth: 0.8mm; Military Standard: Not; Lead Free: Lead Free; RoHS Compliant: Yes; ComponentLink1URL: https://datasheet.ciiva.com/5562/pyu-ac-51-rohs-l-2-5562553.pdf?src-supplier=Mouser; ComponentLink1Description: https://datasheet.ciiva.com/5562/pyu-ac-51-rohs-l-2-5562553.pdf?src-supplier=Mouser; Supplier Part Number 1: 1029044
U?#11 = TPA3111D1PWPR: Amplifier IC 1-Channel (Mono) Class D 28-HTSSOP; Manufacturer: Texas Instruments; Output Power: 10W; Min Supply Voltage: 8V; Max Supply Voltage: 26V; Nominal Supply Current: 40mA; Power Dissipation: 4.98W; Number of Channels: 1; Voltage Gain: 36dB; Gain: 37dB; Load Impedance: 8R; Supplier 1: Mouser; Manufacturer Part Number: TPA3111D1PWPR; RoHS: Yes; Category: Amplifiers - Audio; Pricing 1: 1=2.26000, 10=2.04000, 25=1.92000, 50=1.92000, 100=1.64000, 250=1.54000, 500=1.35000, 1000=1.12000, 2000=1.11000, 10000=1.11000 (USD); Case/Package: HTSSOP; Number of Pins: 28; Min Operating Temperature: -40°C; Max Operating Temperature: 85°C; Packaging: Tape and Reel; Package Quantity: 2000; Max Output Power: 10W; Series: SpeakerGuard™; Supply Current: 40mA; Radiation Hardening: No; Lead Free: Lead Free; RoHS Compliant: Yes; REACH SVHC: No SVHC; ComponentLink1URL: https://datasheet.ciiva.com/15131/getdatasheetpartid-376403-15131942.pdf?src-supplier=Verical; ComponentLink1Description: https://datasheet.ciiva.com/15131/getdatasheetpartid-376403-15131942.pdf?src-supplier=Verical; ComponentLink2URL: https://datasheet.ciiva.com/2969/tpa3111d1-2969959.pdf?src-supplier=Avnet; ComponentLink2Description: https://datasheet.ciiva.com/2969/tpa3111d1-2969959.pdf?src-supplier=Avnet; ComponentLink3URL: https://datasheet.ciiva.com/1789/tpa3111d1-1789051.pdf?src-supplier=Digi-Key; ComponentLink3Description: https://datasheet.ciiva.com/1789/tpa3111d1-1789051.pdf?src-supplier=Digi-Key; Supplier Part Number 1: 595-TPA3111D1PWPR

## Sheet DSP_Section.SchDoc
size A4; SheetNumber: 9; SheetTotal: 9

### Notes on the sheet
- 1
- Huzaifa Ali

## Nets that join several sheets
3V3: Controller_Section (D?#2.1 R?#5.2), ADC_Section (11 pins), Mic_Section (8 pins)
GND: Power_Section (8 pins), Controller_Section (17 pins), ADC_Section (23 pins), Memory_Section (U?#9.4), Mic_Section (16 pins), DAC_Section (C?#49.2 C?#50.2 U?#10.4 U?#10.9), Amplifier_Section (11 pins)
VCC_3V3: Power_Section (C?#2.1 L?#1.2), Controller_Section (14 pins)
VCC_5V: Power_Section (C?#1.1 R?#1.2 U?#1.4 U?#2.6), DAC_Section (R?#10.1)
VCC_5V#: Power_Section (U?#1.1), DAC_Section (C?#49.1 U?#10.6)
VDD_SDIO: Controller_Section (C?#12.1 U?#4.26), Memory_Section (U?#9.8)
BCK_DAC: Controller_Section (U?#6.24), DAC_Section (U?#10.1)
DATA_DAC: Controller_Section (U?#6.14), DAC_Section (U?#10.2)
LRCK_DAC: Controller_Section (U?#4.12), DAC_Section (U?#10.3)
OUT1_N: ADC_Section (C?#17.1), Mic_Section (MIC?#2.2)
OUT1_P: ADC_Section (C?#19.1), Mic_Section (MIC?#2.1)
OUT2_N: ADC_Section (C?#18.1), Mic_Section (MIC?#4.2)
OUT2_P: ADC_Section (C?#20.1), Mic_Section (MIC?#4.1)
OUT3_N: ADC_Section (C?#22.1), Mic_Section (MIC?#6.2)
OUT3_P: ADC_Section (C?#24.1), Mic_Section (MIC?#6.1)
OUT4_N: ADC_Section (C?#21.1), Mic_Section (MIC?#8.2)
OUT4_P: ADC_Section (C?#23.1), Mic_Section (MIC?#8.1)
OUT5_N: ADC_Section (C?#32.1), Mic_Section (MIC?#1.2)
OUT5_P: ADC_Section (C?#34.1), Mic_Section (MIC?#1.1)
OUT6_N: ADC_Section (C?#33.1), Mic_Section (MIC?#3.2)
OUT6_P: ADC_Section (C?#35.1), Mic_Section (MIC?#3.1)
OUT7_N: ADC_Section (C?#37.1), Mic_Section (MIC?#5.2)
OUT7_P: ADC_Section (C?#41.1), Mic_Section (MIC?#5.1)
OUT8_N: ADC_Section (C?#36.1), Mic_Section (MIC?#7.2)
OUT8_P: ADC_Section (C?#40.1), Mic_Section (MIC?#7.1)
SCK_DAC: Controller_Section (U?#6.25), DAC_Section (U?#10.16)
SCLK#: Controller_Section (U?#6.31), Memory_Section (U?#9.6)
SCS#: Controller_Section (U?#6.30), Memory_Section (U?#9.1)
SHD#: Controller_Section (U?#6.28), Memory_Section (U?#9.7)
SI/SIO0: Controller_Section (U?#6.32), Memory_Section (U?#9.5)
SO/SIO1: Controller_Section (U?#6.33), Memory_Section (U?#9.2)
SWP#: Controller_Section (U?#6.29), Memory_Section (U?#9.3)
VOUTL: DAC_Section (C?#47.2), Amplifier_Section (U?#11.12)
VOUTR: DAC_Section (C?#48.2), Amplifier_Section (U?#11.11)